# Altium project Smart-Switch-v2.0.PrjPcb (part 2 of 2)

## Sheet Power-Sheet.SchDoc
size A4; SheetNumber: 2; SheetTotal: 3
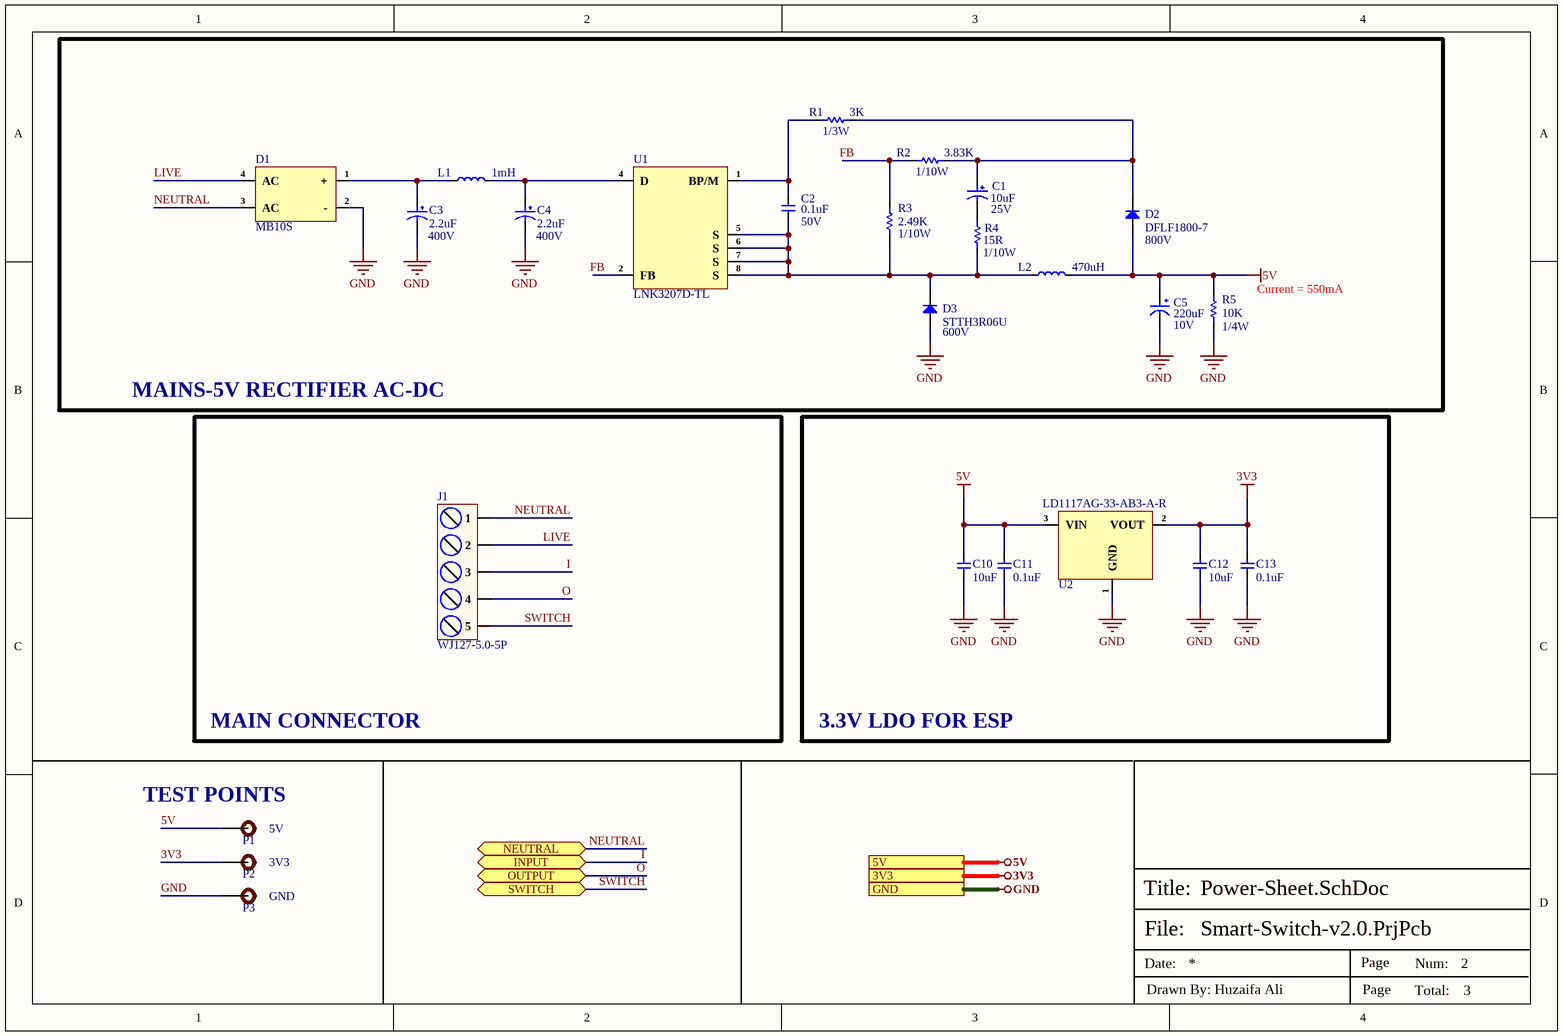
[diagram p2: Power-Sheet.SchDoc]

### Parts
C1  10uF  [Case-B]
C2  0.1uF  [Cap-0603]
C3  2.2uF  [ECG2GM2R2E09OTBO]
C4  2.2uF  [ECG2GM2R2E09OTBO]
C5  220uF  [10ZLQ220MEFC5X11]
C10  10uF  [Cap-0402]
C11  0.1uF  [CAP-0201]
C12  10uF  [Cap-0402]
C13  0.1uF  [CAP-0201]
D1  MB10S  [MBS10S]
D2  DFLF1800-7  [PowerDI123]
D3  STTH3R06U  [SMB_]
J1  WJ127-5.0-5P  [WJ127-5.0-5P]
L1  1mH  [SPK0608-102MB]
L2  470uH  [SMDRI127-471MT]
P1  TEST POINT  [Test-point]  (value not drawn)
P2  TEST POINT  [Test-point]  (value not drawn)
P3  TEST POINT  [Test-point]  (value not drawn)
R1  3K  [Res-0603]
R2  3.83K  [Res-0603]
R3  2.49K  [Res-0603]
R4  15R  [Res-0603]
R5  10K  [RES-0805]
U1  LNK3207D-TL  [SO-8C]
U2  LD1117AG-33-AB3-A-R  [SOT-89-3]

### Blocks framed on the sheet
MAINS-5V RECTIFIER AC-DC: C1-C5 D1-D3 L1 L2 R1-R5 U1
MAIN CONNECTOR: J1
3.3V LDO FOR ESP: C10-C13 U2

### Ports
3V3 (see Top-Sheet[2B], Controller-Sheet[5D]), 5V (see Top-Sheet[2C], Controller-Sheet[5D]), GND (see Top-Sheet[2B], Controller-Sheet[5D]), INPUT (bidir, see Top-Sheet[2B], Controller-Sheet[5D]), NEUTRAL (bidir, see Top-Sheet[2C], Controller-Sheet[5D]), OUTPUT (bidir, see Top-Sheet[2B], Controller-Sheet[5D]), SWITCH (bidir, see Top-Sheet[2C], Controller-Sheet[5D])

### Nets
3V3: C12.2 C13.2 P2.1 U2.2(VOUT) ; port 3V3
5V: C5.1 C10.2 C11.2 D2.1(A) L2.2 P1.1 R5.2 U2.3(VIN) ; port 5V
GND: C3.2 C4.2 C5.2 C10.1 C11.1 C12.1 C13.1 D1.2(-) D3.1(A) P3.1 R5.1 U2.1(GND) ; port GND
FB: R2.1 R3.2 U1.2(FB)
I: J1.3 ; port INPUT
LIVE: D1.4(AC) J1.2
NEUTRAL: D1.3(AC) J1.1 ; port NEUTRAL
O: J1.4 ; port OUTPUT
SWITCH: J1.5 ; port SWITCH
NetC1_1: C1.1 D2.2(K) R1.2 R2.2
NetC1_2: C1.2 R4.2
NetC2_1: C2.1 D3.2(K) L2.1 R3.1 R4.1 U1.5(S) U1.6(S) U1.7(S) U1.8(S)
NetC2_2: C2.2 R1.1 U1.1(BP/M)
NetC3_1: C3.1 D1.1(+) L1.1
NetC4_1: C4.1 L1.2 U1.4(D)

### Notes on the sheet
- (near R1) 1/3W
- (near R2) 1/10W
- (near C3) 400V
- (near C4) 400V
- (near C2) 50V
- (near R3) 1/10W
- 25V
- (near D2) 800V
- (near R4) 1/10W
- (near R5) Current = 550mA
- (near D3) 600V
- 10V
- (near R5) 1/4W
- (near P1) TEST POINTS
- 5V
- 3V3
- GND
- File:
- Title:
- Date:
- Page
- Num:
- Total:
- Drawn By: Huzaifa Ali

### Library data of the parts
C1 = CA45-B025K106T: 10uF 25V 2.5Ω@100kHz ±10% CASE-B-3528 Tantalum Capacitors ROHS; Manufacturer: Xiangyee in S&T; Manufacturer Part Number: CA45-B025K106T; Package: Case-B; LCSC Part Number: C119050; Item Type: Capacitor; ComponentLink1Description: LCSC; ComponentLink1URL: https://www.lcsc.com/product-detail/Tantalum-Capacitors_Hunan-Xiangyee-in-S-T-CA45-B025K106T_C119050.html
C2 = CL10B104KB8NNNC: CAP CER 0.1UF 50V X7R 0603; Manufacturer: Samsung; Material: Ceramic; Capacitance: 100nF; Tolerance: 10%; Supplier 1: Digi-Key; Manufacturer Part Number: CL10B104KB8NNNC; RoHS: Yes; Category: Ceramic Capacitors; Stock 1: 3998791; Pricing 1: 1=0.10000, 10=0.03000, 50=0.01640, 100=0.01340, 500=0.00954, 1000=0.00750 (USD); Mount: Surface Mount; Case/Package: 0603; Case Code (Metric): 1608; Case Code (Imperial): 0603; Contact Plating: Tin; Min Operating Temperature: -55°C; Max Operating Temperature: 125°C; Dielectric: X7R; Voltage Rating: 50V; Package Quantity: 1; Packaging: Tape and Reel; Voltage: 50V; Voltage Rating (DC): 50V; Series: CL; Construction: Flat; Length: 1.6mm; Width: 0.031inch; Height: 0.8mm; Depth: 0.8mm; Thickness: 0.035inch; Radiation Hardening: No; Lead Free: Lead Free; RoHS Compliant: Yes; ComponentLink1URL: https://datasheet.ciiva.com/25803/cl10b104kb8nnnc-25803393.pdf?src-supplier=Digi-Key; ComponentLink1Description: https://datasheet.ciiva.com/25803/cl10b104kb8nnnc-25803393.pdf?src-supplier=Digi-Key; ComponentLink2URL: https://datasheet.ciiva.com/26838/getdatasheetpartid-89097-26838411.pdf?src-supplier=Verical; ComponentLink2Description: https://datasheet.ciiva.com/26838/getdatasheetpartid-89097-26838411.pdf?src-supplier=Verical; ComponentLink3URL: https://datasheet.ciiva.com/29198/456651-da-01-en-vs-kondensator-0605-29198839.pdf?src-supplier=Conrad; ComponentLink3Description: https://datasheet.ciiva.com/29198/456651-da-01-en-vs-kondensator-0605-29198839.pdf?src-supplier=Conrad; Supplier Part Number 1: 1276-1000-1-ND; LCSC Part Number: C1591
C3 C4 = ECG2GM2R2E09OTBO: 2.2uF 400V ±20% 70mA@100kHz Plugin,D6.3xL9mm Aluminum Electrolytic Capacitors - Leaded ROHS; Manufacturer: Yunxing; Manufacturer Part Number: ECG2GM2R2E09OTBO; Package: Plugin,D6.3xL9mm; LCSC Part Number: C525475; Item Type: Capacitor; ComponentLink1Description: LCSC; ComponentLink1URL: https://www.lcsc.com/product-detail/Aluminum-Electrolytic-Capacitors-Leaded_Yunxing-ECG2GM2R2E09OTBO_C525475.html
C5 = 10ZLQ220MEFC5X11: 220uF 10V ±20% Plugin,D5xL11mm Aluminum Electrolytic Capacitors - Leaded ROHS; Manufacturer: Rubycon; Manufacturer Part Number: 10ZLQ220MEFC5X11; Package: Plugin,D5xL11mm; LCSC Part Number: C694058; Item Type: Capacitor; ComponentLink1Description: LCSC; ComponentLink1URL: https://www.lcsc.com/product-detail/Aluminum-Electrolytic-Capacitors-Leaded_Rubycon-10ZLQ220MEFC5X11_C694058.html
C10 C12 = CL05A106MP5NUNC: CAP CER 10UF 10V X5R 0402; Manufacturer: Samsung; Tolerance: 20%; Item Type: Capacitor; Supplier 1: Avnet; Manufacturer Part Number: CL05A106MP5NUNC; RoHS: Yes; Category: Ceramic Capacitors; Stock 1: 1729850; Pricing 1: 10000=0.02537 (USD); Case/Package: 0402; RoHS Compliant: Yes; ComponentLink1URL: https://datasheet.ciiva.com/25721/cl05a106mp5nunc-25721584.pdf?src-supplier=Digi-Key; ComponentLink1Description: https://datasheet.ciiva.com/25721/cl05a106mp5nunc-25721584.pdf?src-supplier=Digi-Key; Supplier Part Number 1: CL05A106MP5NUNC; LCSC Part Number: C315248; Mount: Surface Mount; Case Code (Metric): 1005; Case Code (Imperial): 0402; Contact Plating: Tin; Min Operating Temperature: -55°C; Max Operating Temperature: 85°C; Package Quantity: 1; Packaging: Tape and Reel; Capacitance: 10uF; Voltage Rating: 10V; Dielectric: X5R; Termination: Wraparound; Series: CL; Construction: Flat; Length: 1mm; Width: 0.02inch; Thickness: 0.028inch; Depth: 0.5mm; Radiation Hardening: No; Lead Free: Lead Free; ComponentLink2URL: https://datasheet.ciiva.com/26838/getdatasheetpartid-745310-26838170.pdf?src-supplier=Verical; ComponentLink2Description: https://datasheet.ciiva.com/26838/getdatasheetpartid-745310-26838170.pdf?src-supplier=Verical
C11 C13 = GRM033R61E104KE14D: CAP CER 0.1UF 25V X5R 0201; Manufacturer: Murata; Tolerance: 10%; Item Type: Capacitor; Material: 4241ConductorMaterial; Value: 100nF; Manufacturer Part Number: GRM033R61E104KE14D; RoHS: Yes; Category: Ceramic Capacitors; Case/Package: 0201; Case Code (Metric): 0603; Case Code (Imperial): 0201; Weight: 1.2E-05oz; Min Operating Temperature: -55°C; Max Operating Temperature: 85°C; Packaging: Tape and Reel; Voltage Rating: 25V; Dielectric: X5R; Termination: SMD/SMT; Voltage Rating (DC): 25V; Package Quantity: 15000; Series: GRM; Length: 0.024inch; Width: 0.012inch; Height: 0.3mm; Thickness: 0.013inch; Lead Free: Lead Free; RoHS Compliant: Yes; ComponentLink1URL: http://www.farnell.com/datasheets/2867843.pdf?src-supplier=Farnell; ComponentLink1Description: http://www.farnell.com/datasheets/2867843.pdf?src-supplier=Farnell; ComponentLink2URL: http://www.mouser.com/ds/2/281/c02e-2905.pdf?src-supplier=Mouser; ComponentLink2Description: http://www.mouser.com/ds/2/281/c02e-2905.pdf?src-supplier=Mouser; ComponentLink3URL: https://datasheet.octopart.com/GRM033R61E104KE14D-Murata-datasheet-22122223.pdf?src-supplier=Future+Electronics; ComponentLink3Description: https://datasheet.octopart.com/GRM033R61E104KE14D-Murata-datasheet-22122223.pdf?src-supplier=Future+Electronics; ComponentLink4URL: http://www.farnell.com/datasheets/2867843.pdf?src-supplier=Element14; ComponentLink4Description: http://www.farnell.com/datasheets/2867843.pdf?src-supplier=Element14; ComponentLink5URL: http://search.murata.co.jp/Ceramy/image/img/A01X/G101/ENG/GRM033R61E104KE14-01.pdf?src-supplier=Digi-Key; ComponentLink5Description: http://search.murata.co.jp/Ceramy/image/img/A01X/G101/ENG/GRM033R61E104KE14-01.pdf?src-supplier=Digi-Key; LCSC Part Number: C76939; Supplier: Rs; Supplier Part Number: 1852066; Stock: 14000; Pricing: 1000=0.008, 5000=0.007, 10000=0.006 (GBP); Mounting Technology: Surface Mount; ComponentLink6URL: http://www.farnell.com/datasheets/2867843.pdf?src-supplier=Newark; ComponentLink6Description: http://www.farnell.com/datasheets/2867843.pdf?src-supplier=Newark; ComponentLink7URL: https://datasheet.octopart.com/GRM033R61E104KE14D-Murata-datasheet-165579666.pdf?src-supplier=TME; ComponentLink7Description: https://datasheet.octopart.com/GRM033R61E104KE14D-Murata-datasheet-165579666.pdf?src-supplier=TME
D1 = MB10S: 35A 1.1V@400mA 1A 1kV MBS Bridge Rectifiers ROHS; Manufacturer: MDD; Manufacturer Part Number: MB10S; Package: MBS; JLCPCB Part Number: C2488; Item Type: Bridge Rectifier; ComponentLink1Description: LCSC; ComponentLink1URL: https://www.lcsc.com/product-detail/Bridge-Rectifiers_MCC_MB6S-TP_MB6S-TP_C85619.html?gclid=CjwKCAjwjOunBhB4EiwA94JWsPhP5VxdRhkKtNAXxaeRo8Kbw1z5VNRY74bvbkYd4a4LtLXYHGrsEhoCPX4QAvD_BwE
D2 = DFLF1800-7: 1.35V@1A 500ns 1A 800V Power-DI-123 Fast recovery/high efficiency diode ROHS; Manufacturer: Diodes Incorporated; Manufacturer Part number: DFLF1800-7; Package: Power-DI-123; LCSC Part Number: C460678; Item Type: Diode; ComponentLink1Description: LCSC; ComponentLink1URL: https://www.lcsc.com/product-detail/Fast-recovery-high-efficiency-diode_Diodes-Incorporated-DFLF1800-7_C460678.html
D3 = STTH3R06U: DIODE GEN PURP 600V 3A SMB; Manufacturer: STMicroelectronics; Supplier: Mouser; Supplier Part Number: 511-STTH3R06U; Manufacturer Part Number: STTH3R06U; RoHS: Yes; Category: Rectifier Diodes; Stock: 11406; Pricing: 1=0.87, 10=0.782, 50=0.782, 100=0.61, 1000=0.392, 10000=0.339 (USD); ComponentLink1URL: https://datasheet.ciiva.com/4452/cd00005137-58102-4452784.pdf?src-supplier=Mouser; ComponentLink1Description: https://datasheet.ciiva.com/4452/cd00005137-58102-4452784.pdf?src-supplier=Mouser; ComponentLink2URL: https://datasheet.ciiva.com/22735/1671131-22735253.pdf?src-supplier=Element14; ComponentLink2Description: https://datasheet.ciiva.com/22735/1671131-22735253.pdf?src-supplier=Element14; ComponentLink3URL: https://datasheet.ciiva.com/16491/cd00005137-16491959.pdf?src-supplier=Future+Electronics; ComponentLink3Description: https://datasheet.ciiva.com/16491/cd00005137-16491959.pdf?src-supplier=Future+Electronics; ComponentLink4URL: https://datasheet.ciiva.com/916/cd00005137-916206.pdf?src-supplier=Digikey; ComponentLink4Description: https://datasheet.ciiva.com/916/cd00005137-916206.pdf?src-supplier=Digikey; ComponentLink5URL: https://datasheet.ciiva.com/916/cd00005137-916207.pdf?src-supplier=Digikey; ComponentLink5Description: https://datasheet.ciiva.com/916/cd00005137-916207.pdf?src-supplier=Digikey; ComponentLink6URL: https://datasheet.ciiva.com/916/cd00005137-916208.pdf?src-supplier=Digikey; ComponentLink6Description: https://datasheet.ciiva.com/916/cd00005137-916208.pdf?src-supplier=Digikey; LCSC Part Number: C84189; Item Type: Diode
J1 = WJ127-5.0-5P: 1x5P -40℃~+105℃ 15A 250V Green 14~26 Straight pin 5mm 1.5 1 5 Plugin,P=5mm Screw terminal ROHS; Manufacturer: Ningbo Kangnex Elec; ComponentLink1Description: LCSC; ComponentLink1URL: https://www.lcsc.com/product-detail/Screw-terminal_Ningbo-Kangnex-Elec-WJ127-5-0-5P_C192780.html; Manufacturer Part Number: WJ127-5.0-5P; Package: Plugin,P=5mm; LCSC Part Number: C192780; Item Type: Screw terminal
L1 = SPK0608-102MB: 200mA 1mH ±20% Plugin,D7xL11mm Color Ring Inductors/Through Hole Inductors ROHS; Manufacturer: LanTu Micro; ComponentLink1Description: LCSC; ComponentLink1URL: https://www.lcsc.com/product-detail/Color-Ring-Inductors-Through-Hole-Inductors_LanTu-Micro-SPK0608-102MB_C5127530.html; Manufacturer Part Number: SPK0608-102MB; Package: Plugin,D7xL11mm; LCSC Part Number: C5127530; Item Type: Through Hole Inductor
L2 = SMDRI127-471MT: 470uH Shielded Power Inductors ±20% 1.5A SMD Power Inductors ROHS; Manufacturer: SXN(Shun Xiang Nuo Elec); Manufacturer Part Number: SMDRI127-471MT; Package: SMD; LCSC Part Number: C10153; Item Type: Inductor; ComponentLink1Description: LCSC; ComponentLink1URL: https://www.lcsc.com/product-detail/Power-Inductors_SXN-Shun-Xiang-Nuo-Elec-SMDRI127-471MT_C10153.html
P1-P3 = TEST POINT: Test Point ON; Item Type: TEST POINT
R1 = CRCW06033K00FKEAHP: RES SMD 3K OHM 1% 1/3W 0603; Manufacturer: Vishay Intertech; Manufacturer Part Number: CRCW06033K00FKEAHP; Package: 0603; ComponentLink1Description: LCSC; ComponentLink1URL: https://www.lcsc.com/product-detail/Chip-Resistor-Surface-Mount_Vishay-Intertech-CRCW06033K00FKEAHP_C844164.html; Value: 3K; LCSC Part Number: C844164
R2 = RC0603FR-073K83L: RES 3.83K OHM 1% 1/10W 0603; Manufacturer: Yageo; Value: 3.83kR; Power Rating: 100mW; Voltage Rating: 75V; Temperature Coefficient: 100ppm/°C; Voltage Rating (DC): 50V; Item Type: Resistor; Supplier: Future Electronics; Supplier Part Number: 1517903; Manufacturer Part Number: RC0603FR-073K83L; RoHS: Yes; Category: Chip SMD Resistors; Stock: 400000; Pricing: 5000=0.0009, 75000=0.0009, 250000=0.0008, 750000=0.0008, 2500000=0.0007 (USD); Mounting Technology: Surface Mount; Case/Package: 0603; Case Code (Imperial): 0603; Case Code (Metric): 1608; Weight: 7.1E-05oz; Min Operating Temperature: -55°C; Max Operating Temperature: 155°C; Tolerance: 1%; Packaging: Tape and Reel; Termination: SMD/SMT; Working Voltage: 75V; Number of Terminations: 2; Features: Moisture Resistant; Series: RC; Max Power Dissipation: 100mW; Technology: THICK FILM; Construction: Rectangular; Length: 1.6mm; Width: 0.8mm; Height: 0.45mm; Depth: 0.8mm; Military Standard: Not; Lead Free: Lead Free; RoHS Compliant: Yes; ComponentLink1URL: https://datasheet.ciiva.com/11819/0900766b80f96399-11819347.pdf?src-supplier=Rs; ComponentLink1Description: https://datasheet.ciiva.com/11819/0900766b80f96399-11819347.pdf?src-supplier=Rs; ComponentLink2URL: https://datasheet.ciiva.com/15189/getdatasheetpartid-327814-15189723.pdf?src-supplier=Verical; ComponentLink2Description: https://datasheet.ciiva.com/15189/getdatasheetpartid-327814-15189723.pdf?src-supplier=Verical; LCSC Part Number: C482840
R3 = RC0603FR-072K49L: RES 2.49K OHM 1% 1/10W 0603; Manufacturer: Yageo; Power Rating: 100mW; Temperature Coefficient: 100ppm/°C; Value: 2.49kR; Voltage Rating: 50V; Item Type: Resistor; Supplier: Future Electronics; Supplier Part Number: 4546610; Manufacturer Part Number: RC0603FR-072K49L; RoHS: Yes; Category: Chip SMD Resistors; Stock: 2930000; Pricing: 5000=0.0013, 50000=0.0013, 150000=0.0012, 375000=0.0012, 1000000=0.0011 (USD); Pins: 2NUMBER; Case Code (Imperial): 0603; Case Code (Metric): 1608; Case/Package: 0603; Min Operating Temperature: -55°C; Max Operating Temperature: 155°C; Tolerance: 1%; Series: RC; Packaging: Tape and Reel; Termination: SMD/SMT; Resistor Type: Thick Film; Features: Moisture Resistant; Max Power Dissipation: 100mW; Number of Terminations: 2; Resistance Tolerance: 1%; Voltage Rating (DC): 50V; Length: 1.6mm; Width: 800um; Height: 450um; RoHS Compliant: Yes; Reach SVHC Compliant: Unknown; Lead Free: 5697LeadFree; ComponentLink1URL: https://datasheet.ciiva.com/46395/443971-46395001.pdf?src-supplier=Element14; ComponentLink1Description: https://datasheet.ciiva.com/46395/443971-46395001.pdf?src-supplier=Element14; LCSC Part Number: C108190
R4 = RC0603FR-0715RL: RES 15 OHM 1% 1/10W 0603; Manufacturer: Yageo; Item Type: Resistor; Voltage Rating (AC): 50V; Current Rating: 50mA; Manufacturer Part Number: RC0603FR-0715RL; Lead Free: 5697LeadFree; ComponentLink1URL: https://datasheet.ciiva.com/5989/1686128-5989704.pdf?src-supplier=Farnell; ComponentLink1Description: https://datasheet.ciiva.com/5989/1686128-5989704.pdf?src-supplier=Farnell; ComponentLink2URL: https://datasheet.ciiva.com/8890/pyu-rc0603-51-rohs-l-4-8890742.pdf?src-supplier=Avnet; ComponentLink2Description: https://datasheet.ciiva.com/8890/pyu-rc0603-51-rohs-l-4-8890742.pdf?src-supplier=Avnet; ComponentLink3URL: https://datasheet.ciiva.com/12557/rc0603-272842-12557839.pdf?src-supplier=Mouser; ComponentLink3Description: https://datasheet.ciiva.com/12557/rc0603-272842-12557839.pdf?src-supplier=Mouser; ComponentLink4URL: https://datasheet.ciiva.com/2454/pyu-r-int-thick-7-2454840.pdf?src-supplier=Digikey; ComponentLink4Description: https://datasheet.ciiva.com/2454/pyu-r-int-thick-7-2454840.pdf?src-supplier=Digikey; LCSC Part Number: C128059; Supplier: Future Electronics; Supplier Part Number: 6308514; RoHS: Yes; Category: Chip SMD Resistors; Stock: 5830000; Pricing: 5000=0.0011, 75000=0.001, 200000=0.001, 500000=0.001, 1250000=0.0009 (USD); Weight: 250mg; Contact Material: 157ConductorMaterial; ComponentLink5URL: https://datasheet.ciiva.com/2454/pyu-r-int-thick-7-2454841.pdf?src-supplier=Digikey; ComponentLink5Description: https://datasheet.ciiva.com/2454/pyu-r-int-thick-7-2454841.pdf?src-supplier=Digikey; ComponentLink6URL: https://datasheet.ciiva.com/2454/pyu-r-int-thick-7-2454842.pdf?src-supplier=Digikey; ComponentLink6Description: https://datasheet.ciiva.com/2454/pyu-r-int-thick-7-2454842.pdf?src-supplier=Digikey; ComponentLink7URL: https://datasheet.ciiva.com/7746/443971-7746262.pdf?src-supplier=Element14; ComponentLink7Description: https://datasheet.ciiva.com/7746/443971-7746262.pdf?src-supplier=Element14; ComponentLink8URL: https://datasheet.ciiva.com/7746/443971-7746263.pdf?src-supplier=Element14; ComponentLink8Description: https://datasheet.ciiva.com/7746/443971-7746263.pdf?src-supplier=Element14
R5 = RC0805FR-7W10KL: RES 10K OHM 1% 1/4W 0805; Manufacturer: Yageo; Item Type: Resistor; Supplier: Avnet; Supplier Part Number: 49AK3472; Manufacturer Part Number: RC0805FR-7W10KL; RoHS: Yes; Category: Chip SMD Resistors; Stock: 5000; Pricing: 1=0.153, 25=0.038, 50=0.03, 100=0.02 (USD); LCSC Part Number: C723404
U1 = LNK3207D-TL: IC OFFLINE SWITCH MULT TOP 8SO; Manufacturer: Power Integrations; Supplier: Rs; Supplier Part Number: 2232976; Manufacturer Part Number: LNK3207D-TL; RoHS: No; Category: Voltage Regulators - Switching; Stock: 240; Pricing: 5=1.206, 50=1.026, 100=0.864, 250=0.818, 1000=0.594 (GBP); Item Type: IC
U2 = LD1117AG-33-AB3-A-R: 75dB@(120Hz) 1A Fixed 3.3V~3.3V Positive 15V SOT-89-3 Linear Voltage Regulators (LDO) ROHS; Manufacturer: UTC; Item Type: IC; Manufacturer Part Number: LD1117AG-33-AB3-A-R; Package: SOT-89-3; LCSC Part Number: C81768; ComponentLink1Description: LCSC; ComponentLink1URL: https://www.lcsc.com/product-detail/Linear-Voltage-Regulators-LDO_UTC-Unisonic-Tech-LD1117AG-33-AB3-A-R_C81768.html

## Nets that join several sheets
3V3: Controller-Sheet (18 pins), Power-Sheet (C12.2 C13.2 P2.1 U2.2)
5V: Controller-Sheet (D6.2 K1.1), Power-Sheet (8 pins)
GND: Controller-Sheet (32 pins), Power-Sheet (12 pins)